# Altium schematic sheet Peripherals-Sheet-1.SchDoc (part 3 of 3)
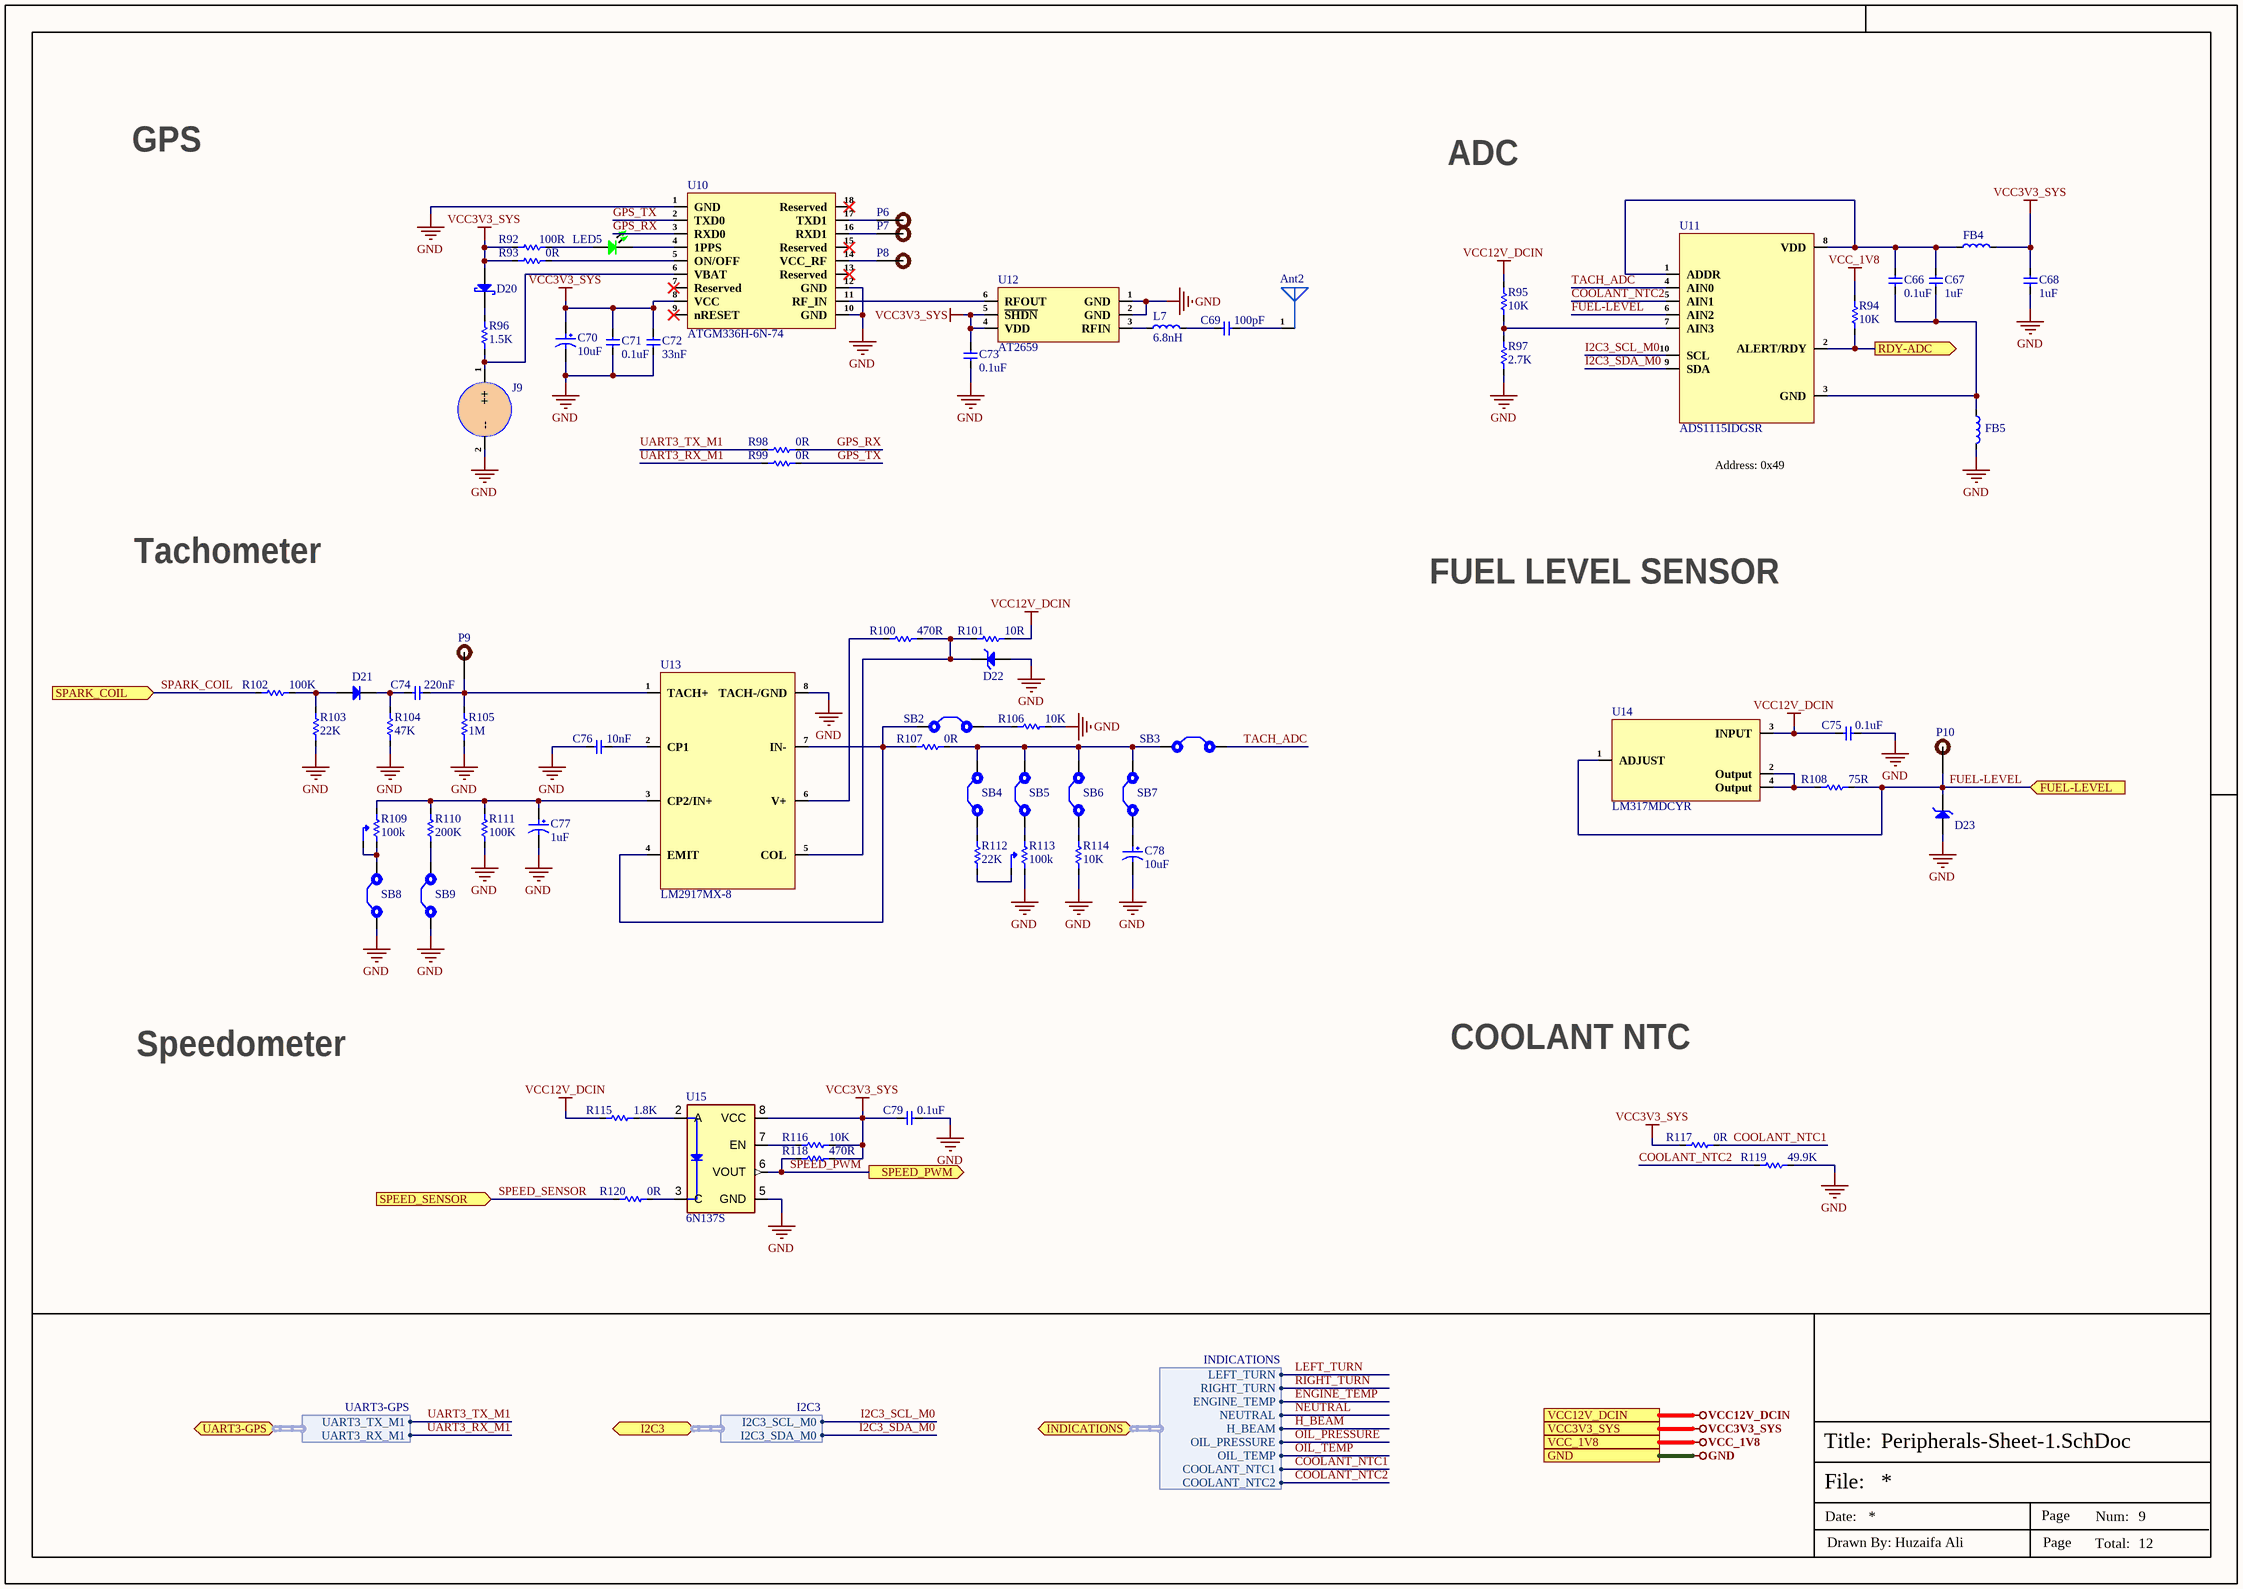
[diagram p2: Peripherals-Sheet-1.SchDoc]

## Library data of the parts (continued)
R111 = RC0402FR-07100KL: RES 100K OHM 1% 1/16W 0402; Manufacturer: Yageo; Resistance: 100kR; Temperature Coefficient: 100ppm/°C; Power Rating: 63mW; Voltage Rating: 50V; Item Type: Resistor; Supplier 1: Mouser; Manufacturer Part Number: RC0402FR-07100KL; RoHS: Yes; Category: Chip SMD Resistors; Stock 1: 7759549; Pricing 1: 1=0.10000, 10=0.01200, 50=0.01200, 100=0.00500, 1000=0.00300, 2500=0.00200, 10000=0.00100 (USD); Case/Package: 0402; Case Code (Metric): 1005; Case Code (Imperial): 0402; Min Operating Temperature: -55°C; Max Operating Temperature: 155°C; Resistor Type: Thick Film; Tolerance: 1%; Packaging: Tape and Reel; Package Quantity: 1; Number of Terminations: 2; Termination: SMD/SMT; Max Power Dissipation: 63mW; Working Voltage: 50V; Features: Moisture Resistant; Series: RC; Resistance Tolerance: 1%; Construction: Rectangular; Technology: THICK FILM; Length: 0.039inch; Width: 0.02inch; Height: 0.016inch; Depth: 0.5mm; REACH SVHC: No SVHC; Lead Free: Lead Free; RoHS Compliant: Yes; Military Standard: Not; ComponentLink1URL: https://datasheet.ciiva.com/11819/0900766b80c66297-11819452.pdf?src-supplier=RSComponents; ComponentLink1Description: https://datasheet.ciiva.com/11819/0900766b80c66297-11819452.pdf?src-supplier=RSComponents; ComponentLink2URL: https://datasheet.ciiva.com/22747/1018594-22747509.pdf?src-supplier=Element14; ComponentLink2Description: https://datasheet.ciiva.com/22747/1018594-22747509.pdf?src-supplier=Element14; ComponentLink3URL: https://datasheet.ciiva.com/2453/pyu-r-int-thick-7-2453362.pdf?src-supplier=Digi-Key; ComponentLink3Description: https://datasheet.ciiva.com/2453/pyu-r-int-thick-7-2453362.pdf?src-supplier=Digi-Key; ComponentLink4URL: https://datasheet.ciiva.com/2453/pyu-r-int-thick-7-2453363.pdf?src-supplier=Digi-Key; ComponentLink4Description: https://datasheet.ciiva.com/2453/pyu-r-int-thick-7-2453363.pdf?src-supplier=Digi-Key; ComponentLink5URL: https://datasheet.ciiva.com/2453/pyu-r-int-thick-7-2453361.pdf?src-supplier=Digi-Key; ComponentLink5Description: https://datasheet.ciiva.com/2453/pyu-r-int-thick-7-2453361.pdf?src-supplier=Digi-Key; ComponentLink6URL: https://datasheet.ciiva.com/12667/pyu-rc0402-51-rohs-l-6-r-12667930.pdf?src-supplier=Mouser; ComponentLink6Description: https://datasheet.ciiva.com/12667/pyu-rc0402-51-rohs-l-6-r-12667930.pdf?src-supplier=Mouser; ComponentLink7URL: https://datasheet.ciiva.com/15189/getdatasheetpartid-323696-15189334.pdf?src-supplier=Verical; ComponentLink7Description: https://datasheet.ciiva.com/15189/getdatasheetpartid-323696-15189334.pdf?src-supplier=Verical; Supplier Part Number 1: 603-RC0402FR-07100KL; LCSC Part Number: C60491
R115 = RC0402FR-071K8L: RES 1.8K OHM 1% 1/16W 0402; Manufacturer: Yageo; Item Type: Resistors; Supplier: Digikey; Supplier Part Number: 311-1.80KLRCT-ND; Manufacturer Part Number: RC0402FR-071K8L; RoHS: Yes; Stock: 584354; Pricing: 1=0.1, 10=0.015, 50=0.0088, 100=0.0073, 500=0.00488, 1000=0.00417, 5000=0.00297 (USD); Lead Free: 5697LeadFree; LCSC Part Number: C163481
R118 = RC0402FR-07470RL: RES 470 OHM 1% 1/16W 0402; Manufacturer: Yageo; Item Type: Resistor; Voltage Rating: 50V; Power Rating: 62.5mW; Temperature Coefficient: 100ppm/°C; Max Power Dissipation: 63mW; Supplier: Avnet; Supplier Part Number: RC0402FR-07470RL; Manufacturer Part Number: RC0402FR-07470RL; RoHS: Yes; Stock: 10000; Pricing: 10000=0.00085 (USD); Case/Package: 0402; Case Code (Metric): 1005; Case Code (Imperial): 0402; Min Operating Temperature: -55°C; Max Operating Temperature: 155°C; Packaging: Tape and Reel; Value: 470R; Tolerance: 1%; Number of Terminations: 2; Working Voltage: 50V; Package Quantity: 1; Resistor Type: Thick Film; Termination: SMD/SMT; Features: Moisture Resistant; Series: RC; Resistance Tolerance: 1%; Construction: Rectangular; Voltage Rating (AC): 50V; Length: 1mm; Width: 0.02inch; Height: 0.016inch; Depth: 0.5mm; Lead Free: Lead Free; Reach SVHC Compliant: No; RoHS Compliant: Yes; Military Standard: Not; ComponentLink1URL: https://datasheet.ciiva.com/46412/1018594-46412838.pdf?src-supplier=Element14; ComponentLink1Description: https://datasheet.ciiva.com/46412/1018594-46412838.pdf?src-supplier=Element14; ComponentLink2URL: https://datasheet.ciiva.com/2453/pyu-r-int-thick-7-2453377.pdf?src-supplier=Digikey; ComponentLink2Description: https://datasheet.ciiva.com/2453/pyu-r-int-thick-7-2453377.pdf?src-supplier=Digikey; ComponentLink3URL: https://datasheet.ciiva.com/2453/pyu-r-int-thick-7-2453378.pdf?src-supplier=Digikey; ComponentLink3Description: https://datasheet.ciiva.com/2453/pyu-r-int-thick-7-2453378.pdf?src-supplier=Digikey; ComponentLink4URL: https://datasheet.ciiva.com/2453/pyu-r-int-thick-7-2453376.pdf?src-supplier=Digikey; ComponentLink4Description: https://datasheet.ciiva.com/2453/pyu-r-int-thick-7-2453376.pdf?src-supplier=Digikey; ComponentLink5URL: https://datasheet.ciiva.com/7850/1018594-7850015.pdf?src-supplier=Element14; ComponentLink5Description: https://datasheet.ciiva.com/7850/1018594-7850015.pdf?src-supplier=Element14; ComponentLink6URL: https://datasheet.ciiva.com/7850/1018594-7850014.pdf?src-supplier=Element14; ComponentLink6Description: https://datasheet.ciiva.com/7850/1018594-7850014.pdf?src-supplier=Element14; ComponentLink7URL: https://datasheet.ciiva.com/15189/getdatasheetpartid-330246-15189463.pdf?src-supplier=Verical; ComponentLink7Description: https://datasheet.ciiva.com/15189/getdatasheetpartid-330246-15189463.pdf?src-supplier=Verical; LCSC Part Number: C114877
R119 = RC0402FR-0749K9L: RES 49.9K OHM 1% 1/16W 0402; Manufacturer: Yageo; Power Rating: 62.5mW; Value: 49.9kR; Voltage Rating: 50V; Temperature Coefficient: 100ppm/°C; Max Power Dissipation: 63mW; Item Type: Resistor; Supplier: Digikey; Supplier Part Number: 311-49.9KLRCT-ND; Manufacturer Part Number: RC0402FR-0749K9L; RoHS: Yes; Category: Chip SMD Resistors; Stock: 5084418; Pricing: 1=0.1, 10=0.015, 50=0.0088, 100=0.0073, 500=0.00488, 1000=0.00417, 5000=0.00297 (USD); Case/Package: 0402; Case Code (Imperial): 0402; Case Code (Metric): 1005; Min Operating Temperature: -55°C; Max Operating Temperature: 155°C; Tolerance: 1%; Packaging: Tape and Reel; Termination: SMD/SMT; Voltage Rating (DC): 50V; Features: Moisture Resistant; Series: RC; Number of Terminations: 2; Construction: Rectangular; Length: 1mm; Depth: 0.5mm; RoHS Compliant: Yes; Military Standard: Not; Lead Free: Lead Free; ComponentLink1URL: https://datasheet.ciiva.com/17071/pyu-rc0402-51-rohs-l-6-r-17071066.pdf?src-supplier=Future+Electronics; ComponentLink1Description: https://datasheet.ciiva.com/17071/pyu-rc0402-51-rohs-l-6-r-17071066.pdf?src-supplier=Future+Electronics; LCSC Part Number: C137969
R120 = RC0402FR-070RL: RES 0 OHM JUMPER 1/16W 0402; Manufacturer: Yageo; Item Type: Resistors; Tolerance: 1%; Power Rating: 62.5mW; Voltage Rating: 50V; Temperature Coefficient: 200ppm/°C; Max Power Dissipation: 63mW; Supplier 1: Mouser; Manufacturer Part Number: RC0402FR-070RL; RoHS: Yes; Stock 1: 8556842; Pricing 1: 1=0.10000, 10=0.01400, 50=0.01400, 100=0.00600, 1000=0.00300, 5000=0.00200, 10000=0.00100 (USD); Mount: Surface Mount; Case/Package: 0402; Contact Plating: Tin,Matte; Case Code (Imperial): 0402; Case Code (Metric): 1005; Size Code: 0402; Min Operating Temperature: -55°C; Max Operating Temperature: 155°C; Resistance: 0R; Resistor Type: Thick Film; Packaging: Tape and Reel; Termination: SMD/SMT; Features: Moisture Resistant; Series: RC; Number of Terminations: 2; Length: 1mm; Width: 0.5mm; Height: 0.35mm; Radiation Hardening: No; Lead Free: Lead Free; RoHS Compliant: Yes; ComponentLink1URL: https://datasheet.ciiva.com/8896/pyu-rc0402-51-rohs-l-6-8896149.pdf?src-supplier=Avnet; ComponentLink1Description: https://datasheet.ciiva.com/8896/pyu-rc0402-51-rohs-l-6-8896149.pdf?src-supplier=Avnet; ComponentLink2URL: https://datasheet.ciiva.com/16790/pyu-rc0402-51-rohs-l-6-r-16790444.pdf?src-supplier=Future+Electronics; ComponentLink2Description: https://datasheet.ciiva.com/16790/pyu-rc0402-51-rohs-l-6-r-16790444.pdf?src-supplier=Future+Electronics; Supplier Part Number 1: 603-RC0402FR-070RL; LCSC Part Number: C106231
SB2-SB9 = Solder Bridge 0603: Solder Bridge ON; Manufacturer Part Number: Solder Bridge; Item Type: Solder Bridge
U10 = ATGM336H-6N-74: SMD,10.1x9.7mm Satellite Positioning Modules ROHS; Manufacturer: ZHONGKEWEI; Manufacturer Part Number: ATGM336H-6N-74; Package: SMD,10.1x9.7mm; LCSC Part Number: C5804601; ComponentLink1Description: LCSC; ComponentLink1URL: https://www.lcsc.com/product-detail/Satellite-Positioning-Modules_ZHONGKEWEI-ATGM336H-6N-74_C5804601.html
U11 = ADS1115IDGSR: IC ADC 16BIT SIGMA-DELTA 10VSSOP; Manufacturer: Texas Instruments; Interface: I2C; Number of Bits: 16; Sampling Rate: 860S/s; Number of A/D Converters: 1; Resolution: 16b; Polarity: Bipolar; Min Supply Voltage: 2V; Max Supply Voltage: 5.5V; Supply Type: Single; Conversion Rate: 0.86KS/s; Number of Inputs: 4; Integral Nonlinearity (INL): 1LSB; Power Dissipation: 900uW; Nominal Supply Current: 150uA; Number of Channels: 2; Supplier: Mouser; Supplier Part Number: 595-ADS1115IDGSR; Manufacturer Part Number: ADS1115IDGSR; RoHS: Yes; Category: Analog to Digital Converters (ADCs); Stock: 5925; Pricing: 1=5.44, 10=4.76, 50=4.76, 100=4.01, 1000=2.88, 10000=2.78 (USD); Case/Package: VSSOP; Pins: 10; Contact Plating: Gold; Min Operating Temperature: -40°C; Max Operating Temperature: 125°C; Package Quantity: 2500; Packaging: Tape and Reel; Number of Converters: 1; Max Supply Voltage (DC): 5.5V; Min Supply Voltage (DC): 2V; Series: -; Length: 3mm; Width: 3mm; Height: 1.07mm; Thickness: 1.02mm; Reach SVHC Compliant: No; Lead Free: Lead Free; RoHS Compliant: Yes; ComponentLink1URL: https://datasheet.ciiva.com/4031/47725463s8438921n7713-4031028.pdf?src-supplier=Arrow+Electronics; ComponentLink1Description: https://datasheet.ciiva.com/4031/47725463s8438921n7713-4031028.pdf?src-supplier=Arrow+Electronics; LCSC Part Number: C37593; Item Type: IC
U12 = AT2659: 1.4V~3.6V 4.3mA DFN-6(1x1.6) Low Noise Amplifiers (LNA) - RF ROHS; Manufacturer: ZHONGKEWEI; Manufacturer Part Number: AT2659; Package: DFN-6(1x1.6); LCSC Part Number: C92450; Item Type: LNA; ComponentLink1Description: LCSC; ComponentLink1URL: https://www.lcsc.com/product-detail/Low-Noise-Amplifiers-LNA-RF_ZHONGKEWEI-AT2659_C92450.html
U13 = LM2917MX-8: IC F/V CONV 10KHZ 8SOIC; Manufacturer: TI National Semiconductor; Supplier: Digikey; Supplier Part Number: 296-36310-2-ND; Manufacturer Part Number: LM2917MX-8; RoHS: No; Item Type: IC; Pricing: 2500=1.20124, 5000=1.15675 (USD); Lead Free: 5698LeadFree; ComponentLink1URL: https://datasheet.ciiva.com/15145/getdatasheetpartid-629387-15145650.pdf?src-supplier=Verical; ComponentLink1Description: https://datasheet.ciiva.com/15145/getdatasheetpartid-629387-15145650.pdf?src-supplier=Verical; ComponentLink2URL: https://datasheet.ciiva.com/18553/lm2917-n-18553573.pdf?src-supplier=Digikey; ComponentLink2Description: https://datasheet.ciiva.com/18553/lm2917-n-18553573.pdf?src-supplier=Digikey; ComponentLink3URL: https://datasheet.ciiva.com/18553/lm2917-n-18553575.pdf?src-supplier=Digikey; ComponentLink3Description: https://datasheet.ciiva.com/18553/lm2917-n-18553575.pdf?src-supplier=Digikey
U14 = LM317MDCYR: IC REG LIN POS ADJ 500MA SOT223; Manufacturer: Texas Instruments; Output Voltage: 37V; Number of Outputs: 1; Min Input Voltage: 4.2V; Max Supply Voltage: 40V; Polarity: Positive; Min Output Voltage: 1.25V; Quiescent Current: 3.5mA; Output Type: Adjustable; Reference Voltage: 1.3V; Power Supply Rejection Ratio (PSRR): 80dB; Supplier: Mouser; Supplier Part Number: 595-LM317MDCYR; Manufacturer Part Number: LM317MDCYR; RoHS: Yes; Category: Voltage Regulators - Linear; Stock: 12890; Pricing: 1=0.67, 10=0.564, 50=0.564, 100=0.428, 500=0.359, 1000=0.283, 2500=0.263, 5000=0.245, 10000=0.236, 25000=0.227 (USD); Mounting Technology: Surface Mount; Case/Package: SOT-223-4; Pins: 4; Weight: 0.006632oz; Min Operating Temperature: -40°C; Max Operating Temperature: 125°C; Packaging: Tape and Reel; Output Current: 500mA; Number of Regulators: 1; Max Output Voltage: 37V; Package Quantity: 1; Max Output current: 500mA; Series: -; Radiation Hardening: No; Reach SVHC Compliant: No; Lead Free: Lead Free; RoHS Compliant: Yes; ComponentLink1URL: https://datasheet.ciiva.com/1643/755612-1643356.pdf?src-supplier=Newark; ComponentLink1Description: https://datasheet.ciiva.com/1643/755612-1643356.pdf?src-supplier=Newark; ComponentLink2URL: https://datasheet.ciiva.com/41458/001014040-da-01-en-ic-reg-adj-0-5-lm317mdcyr-sot-223-4-tid-41458215.pdf?src-supplier=Conrad; ComponentLink2Description: https://datasheet.ciiva.com/41458/001014040-da-01-en-ic-reg-adj-0-5-lm317mdcyr-sot-223-4-tid-41458215.pdf?src-supplier=Conrad; ComponentLink3URL: https://datasheet.ciiva.com/1512/1814942-1512040.pdf?src-supplier=Element14; ComponentLink3Description: https://datasheet.ciiva.com/1512/1814942-1512040.pdf?src-supplier=Element14; ComponentLink4URL: https://datasheet.ciiva.com/46398/755612-46398903.pdf?src-supplier=Element14; ComponentLink4Description: https://datasheet.ciiva.com/46398/755612-46398903.pdf?src-supplier=Element14; ComponentLink5URL: https://datasheet.ciiva.com/46419/1814942-46419370.pdf?src-supplier=Element14; ComponentLink5Description: https://datasheet.ciiva.com/46419/1814942-46419370.pdf?src-supplier=Element14; ComponentLink6URL: https://datasheet.ciiva.com/2042/lm317m-2042100.pdf?src-supplier=Digikey; ComponentLink6Description: https://datasheet.ciiva.com/2042/lm317m-2042100.pdf?src-supplier=Digikey; ComponentLink7URL: https://datasheet.ciiva.com/2042/lm317m-2042099.pdf?src-supplier=Digikey; ComponentLink7Description: https://datasheet.ciiva.com/2042/lm317m-2042099.pdf?src-supplier=Digikey; ComponentLink8URL: https://datasheet.ciiva.com/2042/lm317m-2042101.pdf?src-supplier=Digikey; ComponentLink8Description: https://datasheet.ciiva.com/2042/lm317m-2042101.pdf?src-supplier=Digikey; ComponentLink9URL: https://datasheet.ciiva.com/14280/lm317mq-14280776.pdf?src-supplier=Avnet; ComponentLink9Description: https://datasheet.ciiva.com/14280/lm317mq-14280776.pdf?src-supplier=Avnet; LCSC Part Number: C840113; Item Type: IC
U15 = 6N137S: Logic Output Optoisolator 15MBd Open Collector 5000Vrms 1 Channel 10kV/Âµs CMTI 8-SMD; MF: Lite-On Electronics; SnapEDA_Link: https://www.snapeda.com/parts/6N137S/Applied+Avionics/view-part/?ref=snap; Package: SMD-8 Lite-On Inc.; Value: *; MP: 6N137S; Check_prices: https://www.snapeda.com/parts/6N137S/Applied+Avionics/view-part/?ref=eda